# Altium project LED_CLUSTER.PrjPcb
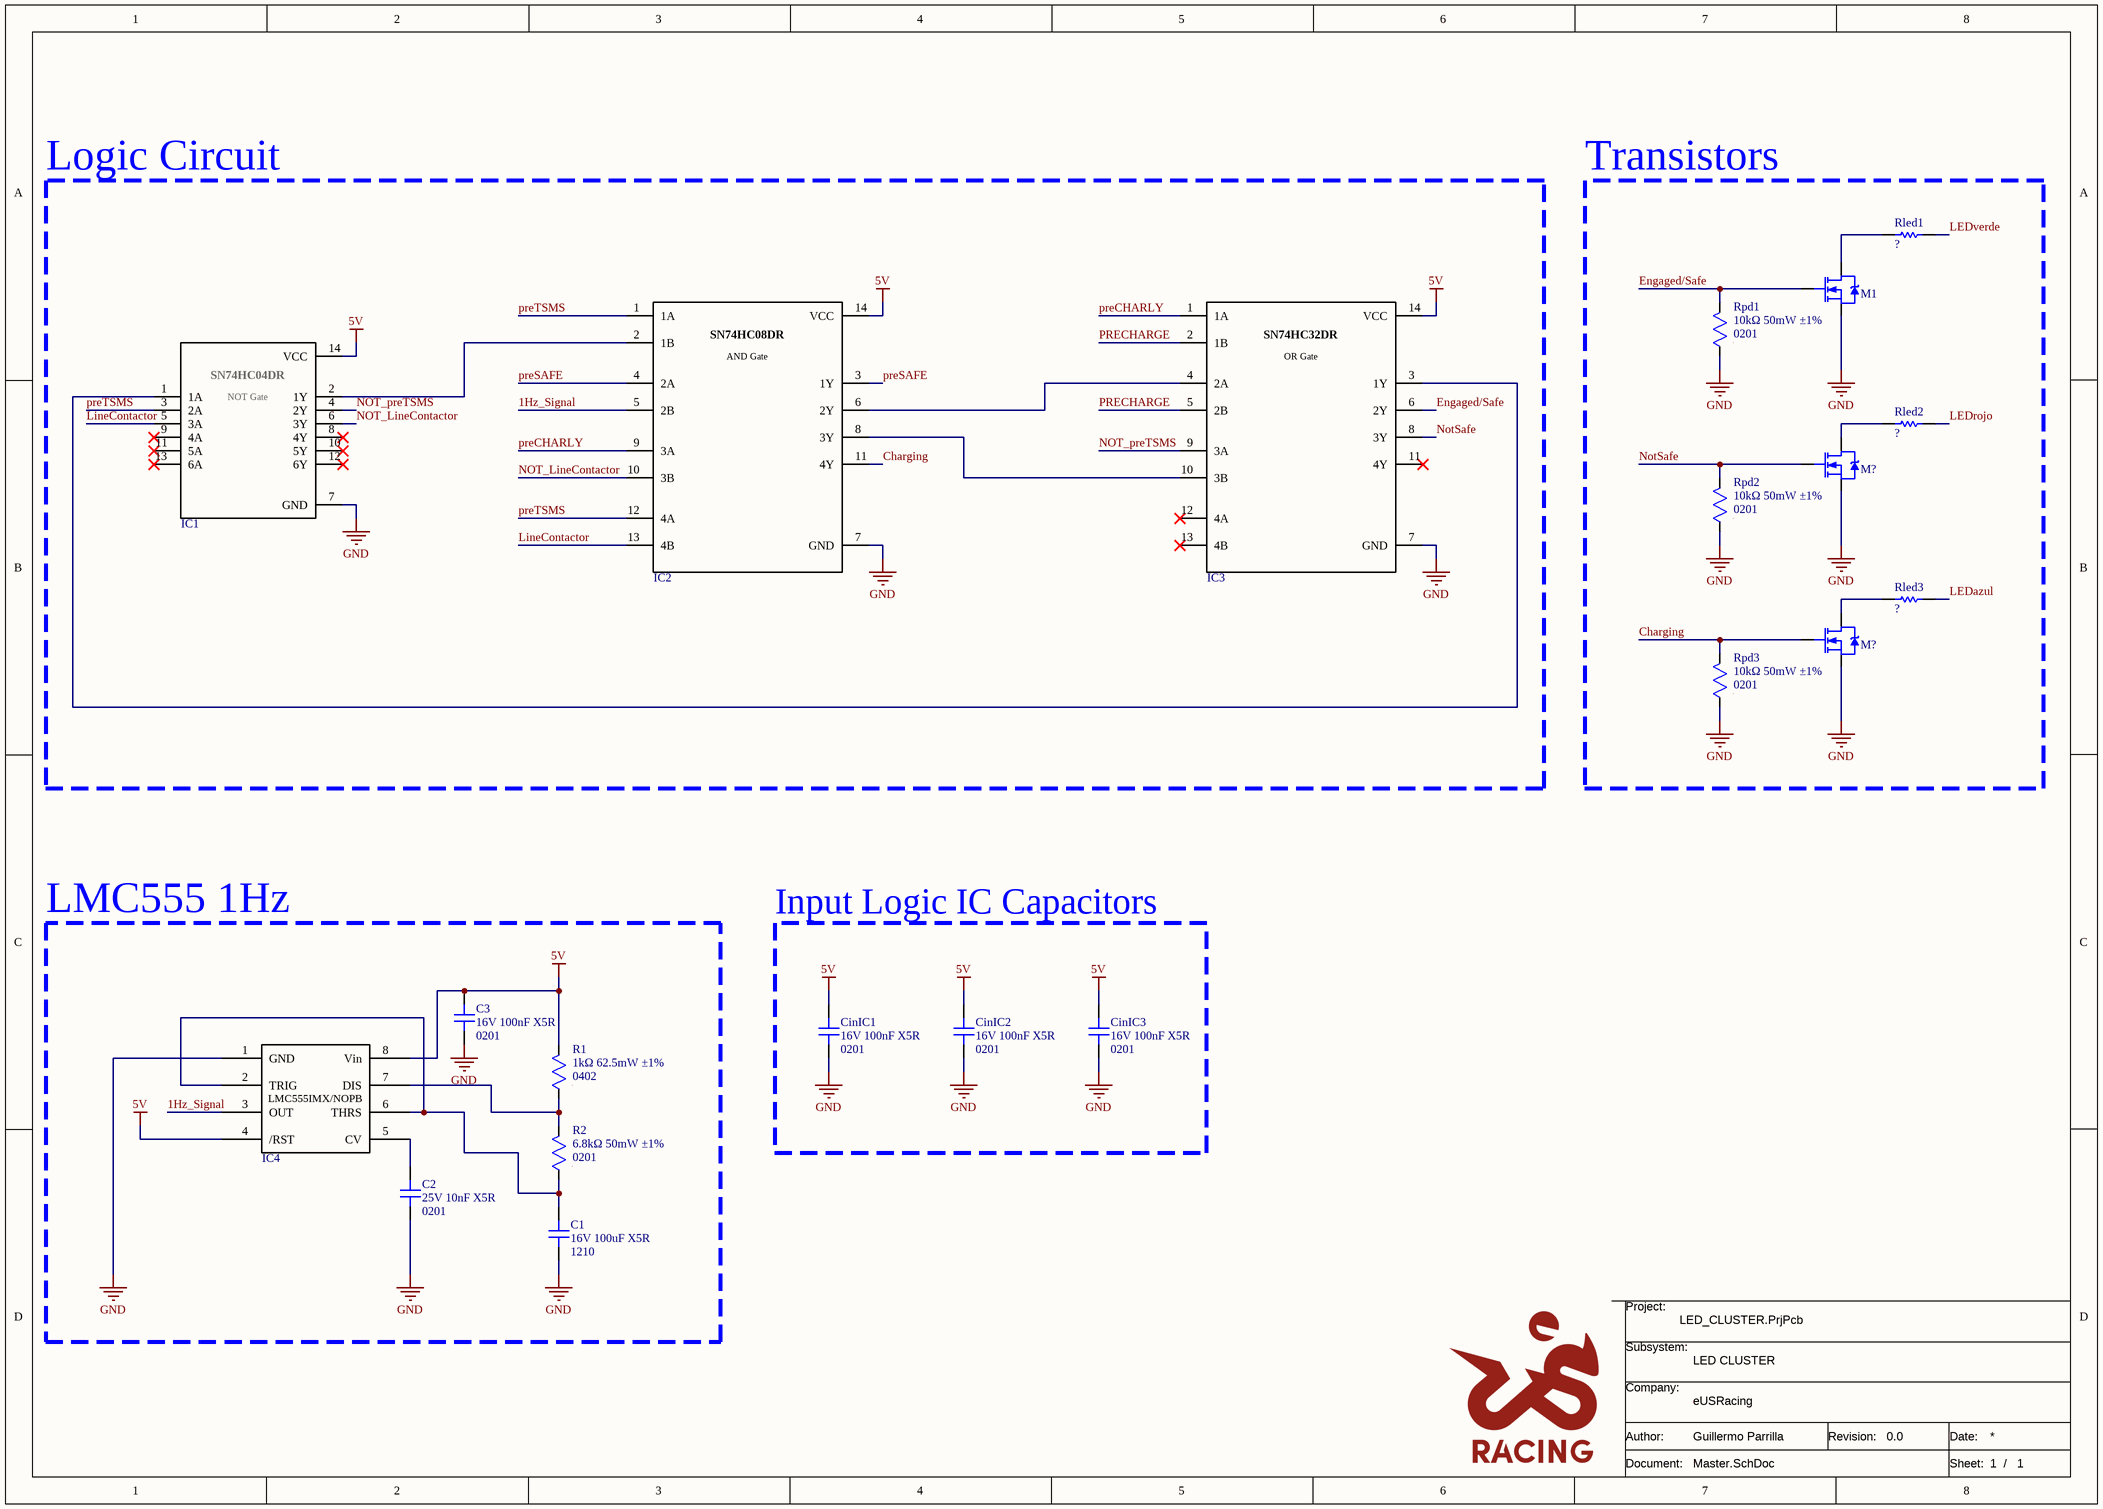
[diagram p0: Master.SchDoc]
Revision: 0.0; Project: LED Cluster; Date: 07/06/2026; Author: eUSRacing
1 sheet, 21 parts. Net scope: global (net labels, ports and power ports of the same name join across sheets).
Board file: LED_CLUSTER.PcbDoc

## Sheet Master.SchDoc: LED CLUSTER
size A3; CompanyName: eUSRacing; DrawnBy: Guillermo Parrilla; SheetNumber: 1; SheetTotal: 1

### Parts
(Parts that share a designator on the sheet are numbered #1, #2 ... from top to bottom, then left to right.)
C1  value 16V 100uF X5R  Package: 1210  [CAP SMD 1210]  (hidden comment: CAP non polarized)
C2  value 25V 10nF X5R  Package: 0201  [CAP SMD 0201]  (hidden comment: CAP non polarized)
C3  value 16V 100nF X5R  Package: 0201  [CAP SMD 0201]  (hidden comment: CAP non polarized)
CinIC1  value 16V 100nF X5R  Package: 0201  [CAP SMD 0201]  (hidden comment: CAP non polarized)
CinIC2  value 16V 100nF X5R  Package: 0201  [CAP SMD 0201]  (hidden comment: CAP non polarized)
CinIC3  value 16V 100nF X5R  Package: 0201  [CAP SMD 0201]  (hidden comment: CAP non polarized)
IC1  SN74HC04DR  [SOIC-14]  (value not drawn)
IC2  SN74HC08DR  [SOIC-14]  (value not drawn)
IC3  SN74HC32DR  [SOIC-14]  (value not drawn)
IC4  LMC555IMX/NOPB  [SOIC-8]  (value not drawn)
M1  MOSFET N  [SOT-323]  (value not drawn)
M?#1  MOSFET N  [SOT-323]  (value not drawn)
M?#2  MOSFET N  [SOT-323]  (value not drawn)
R1  value 1kΩ 62.5mW ±1%  Package: 0402  [RES SMD 0402]  (hidden comment: RES)
R2  value 6.8kΩ 50mW ±1%  Package: 0201  [RES SMD 0201]  (hidden comment: RES)
Rled1  Resistor  (value not drawn)
Rled2  Resistor  (value not drawn)
Rled3  Resistor  (value not drawn)
Rpd1  value 10kΩ 50mW ±1%  Package: 0201  [RES SMD 0201]  (hidden comment: RES)
Rpd2  value 10kΩ 50mW ±1%  Package: 0201  [RES SMD 0201]  (hidden comment: RES)
Rpd3  value 10kΩ 50mW ±1%  Package: 0201  [RES SMD 0201]  (hidden comment: RES)

### Blocks framed on the sheet
Logic Circuit: IC1-IC3
Transistors: M1 M?#1 M?#2 Rled1-Rled3 Rpd1-Rpd3
LMC555 1Hz: C1-C3 IC4 R1 R2
Input Logic IC Capacitors: CinIC1-CinIC3

### Nets
5V: C3.1 CinIC1.1 CinIC2.1 CinIC3.1 IC1.14(VCC) IC2.14(VCC) IC3.14(VCC) IC4.4(/RST) IC4.8(Vin) R1.2
GND: C1.2 C2.2 C3.2 CinIC1.2 CinIC2.2 CinIC3.2 IC1.7(GND) IC2.7(GND) IC3.7(GND) IC4.1(GND) M1.2(S) M?#1.2(S) M?#2.2(S) Rpd1.1 Rpd2.1 Rpd3.1
1Hz_Signal: IC2.5(2B) IC4.3(OUT)
Charging: IC2.11(4Y) M?#2.1(G) Rpd3.2
Engaged/Safe: IC3.6(2Y) M1.1(G) Rpd1.2
LEDazul: Rled3.2
LEDrojo: Rled2.2
LEDverde: Rled1.2
LineContactor: IC1.5(3A) IC2.13(4B)
NOT_LineContactor: IC1.6(3Y) IC2.10(3B)
NOT_preTSMS: IC1.4(2Y) IC3.9(3A)
NotSafe: IC3.8(3Y) M?#1.1(G) Rpd2.2
PRECHARGE: IC3.2(1B) IC3.5(2B)
preCHARLY: IC2.9(3A) IC3.1(1A)
preSAFE: IC2.3(1Y) IC2.4(2A)
preTSMS: IC1.3(2A) IC2.1(1A) IC2.12(4A)
NetC1_1: C1.1 IC4.2(TRIG) IC4.6(THRS) R2.1
NetC2_1: C2.1 IC4.5(CV)
NetIC1_1: IC1.1(1A) IC3.3(1Y)
NetIC1_2: IC1.2(1Y) IC2.2(1B)
NetIC2_6: IC2.6(2Y) IC3.4(2A)
NetIC2_8: IC2.8(3Y) IC3.10(3B)
NetIC4_7: IC4.7(DIS) R1.1 R2.2
NetM1_3: M1.3(D) Rled1.1
NetM?#1_3: M?#1.3(D) Rled2.1
NetM?#2_3: M?#2.3(D) Rled3.1

Not connected (* = marked no-connect by the designer): IC1 8(4Y)* 9(4A)* 10(5Y)* 11(5A)* 12(6Y)* 13(6A)*; IC3 11(4Y)* 12(4A)* 13(4B)*

### Notes on the sheet
- Project:
- Subsystem:
- Company:
- Document:
- Author:
- Revision:
- Date:
- Sheet:
- /

### Library data of the parts
C1 = 001-0065: 16V 100uF X5R ±20% 1210 Multilayer Ceramic Capacitors MLCC - SMD/SMT ROHS; MPN: HGC1210R5107M160NSVK; Manufacturer: Chinocera; ComponentLink1Description: Datasheet; ComponentLink1URL: https://www.lcsc.com/datasheet/lcsc_datasheet_2410121645_Chinocera-HGC1210R5107M160NSVK_C7432790.pdf; ComponentLink2Description: Distributor Link; ComponentLink2URL: https://www.lcsc.com/product-detail/Multilayer-Ceramic-Capacitors-MLCC-SMD-SMT_Chinocera-HGC1210R5107M160NSVK_C7432790.html; ID: 001-0065; Distributor PN: C7432790; Distributor: LCSC
C2 = 001-0012: 25V 10nF X5R ±10% 0201 Multilayer Ceramic Capacitors MLCC - SMD/SMT ROHS; MPN: GRM033R61E103KA12D; Manufacturer: Murata Electronics; ComponentLink1Description: Datasheet; ComponentLink1URL: https://www.lcsc.com/datasheet/lcsc_datasheet_1811081532_Murata-Electronics-GRM033R61E103KA12D_C76938.pdf; ComponentLink2Description: Distributor Link; ComponentLink2URL: https://www.lcsc.com/product-detail/Multilayer-Ceramic-Capacitors-MLCC-SMD-SMT_Murata-Electronics-GRM033R61E103KA12D_C76938.html; ID: 001-0012; Distributor PN: C76938; Distributor: LCSC
C3 CinIC1-CinIC3 = 001-0010: 16V 100nF X5R ±10% 0201 Multilayer Ceramic Capacitors MLCC - SMD/SMT ROHS; MPN: CL03A104KO3NNNC; Manufacturer: Samsung Electro-Mechanics; ComponentLink1Description: Datasheet; ComponentLink1URL: https://www.lcsc.com/datasheet/lcsc_datasheet_2304140030_Samsung-Electro-Mechanics-CL03A104KO3NNNC_C307380.pdf; ComponentLink2Description: Distributor Link; ComponentLink2URL: https://www.lcsc.com/product-detail/Multilayer-Ceramic-Capacitors-MLCC-SMD-SMT_Samsung-Electro-Mechanics-CL03A104KO3NNNC_C307380.html; ID: 001-0010; Distributor PN: C307380; Distributor: LCSC
IC1 = 051-0003: Inversores Hex A 595-SN74HC04D A 595-SN74HC04D A 59 A 595-SN74HC04D; Manufacturer: TI; Value: NOT Gate; ComponentLink1Description: Datasheet; ComponentLink1URL: https://www.ti.com/lit/gpn/sn54hc04-sp; ComponentLink2Description: Distributor Link; ComponentLink2URL: https://eu.mouser.com/es/ProductDetail/Texas-Instruments/SN74HC04DR?qs=5BZzbFV4k2tw1CBjnu%2F%252B9Q%3D%3D; ID: 051-0003; Package: SOIC-14; MPN: SN74HC04DR; Distributor PN: 595-SN74HC04DR; Distributor: Mouser
IC2 = 051-0002: Puertas lógicas Quad 2-Input A 595-S N74HC08D A 595-SN74 A 595-SN74HC08D; Manufacturer: TI; Value: AND Gate; ComponentLink1Description: Datasheet; ComponentLink1URL: https://www.ti.com/lit/gpn/sn54hc08-sp; ComponentLink2Description: Distributor Link; ComponentLink2URL: https://eu.mouser.com/es/ProductDetail/Texas-Instruments/SN74HC08DR?qs=sGAEpiMZZMutXGli8Ay4kEEIpW4eUuOm7aqjfwxQiBw%3D; ID: 051-0002; Package: SOIC-14; MPN: SN74HC08DR; Distributor PN: 595-SN74HC08DR; Distributor: Mouser
IC3 = 051-0001: Puertas lógicas Quad 2-Input A 595-S N74HCT32N A 595-SN7 A 595-SN74HCT32N; Manufacturer: TI; Value: OR Gate; ComponentLink1Description: Datasheet; ComponentLink1URL: https://www.ti.com/lit/gpn/sn74hc32; ComponentLink2Description: Distributor Link; ComponentLink2URL: https://eu.mouser.com/es/ProductDetail/Texas-Instruments/SN74HC32DR?qs=JHHQeKcAU3Du%2FzZijx6RtA%3D%3D; ID: 051-0001; Package: SOIC-14; MPN: SN74HC32DR; Distributor PN: 595-SN74HC32DR; Distributor: Mouser
IC4 = 051-0004: Temporizadores y productos de apoyo CMOS Timer A 595-LMC 555IM/NOPB A 595-LM A 595-LMC555IM/NOPB; Manufacturer: TI; Value: "555"; ComponentLink1Description: Datasheet; ComponentLink1URL: https://www.ti.com/lit/gpn/lmc555; ComponentLink2Description: Distributor Link; ComponentLink2URL: https://eu.mouser.com/es/ProductDetail/Texas-Instruments/LMC555IMX-NOPB?qs=sGAEpiMZZMutXGli8Ay4kNAnUfdQpJkZNpfT8w9oXWg%3D; ID: 051-0004; Package: SOIC-8; MPN: LMC555IMX/NOPB; Distributor PN: 595-LMC555IMX/NOPB; Distributor: Mouser
M1 M?#1 M?#2 = 043-0004: MOSFET 30V N-Channel Enhancement Mode MOSFET; MPN: PJC7400_R1_00001; Manufacturer: Panjit; ComponentLink1Description: Datasheet; ComponentLink1URL: https://eu.mouser.com/datasheet/3/3736/1/57EA10CD49B35B6F90316A98635696137E5C0903FA72E2DBB5D027E51D732D72.pdf; ComponentLink2Description: Distributor Link; ComponentLink2URL: https://eu.mouser.com/es/ProductDetail/Panjit/PJC7400_R1_00001?qs=sPbYRqrBIVlqNtfR5hXF4A%3D%3D; ID: 043-0004; Value: N; Package: SOT-323; Distributor PN: 241-PJC7400_R1_00001; Distributor: Mouser
R1 = 010-0113: 62.5mW 1kΩ 50V ±100ppm/℃ Thick Film Resistor ±1% 0402 Chip Resistor - Surface Mount ROHS; MPN: FRC0402F1001TS; Manufacturer: FOJAN; ComponentLink1Description: Datasheet; ComponentLink1URL: https://www.lcsc.com/product-detail/C2906864.html?s_z=n_FRC0402F1001TS; ComponentLink2Description: Distributor Link; ComponentLink2URL: https://www.lcsc.com/product-detail/C2906864.html?s_z=n_FRC0402F1001TS; ID: 010-0113; Distributor PN: C2906864; Distributor: LCSC
R2 = 010-0073: 50mW Thick Film Resistors 25V ±1% ±200ppm/℃ 6.8kΩ 0201 Chip Resistor - Surface Mount ROHS; MPN: 0201WMF6801TEE; Manufacturer: UNI-ROYAL(Uniroyal Elec); ComponentLink1Description: Datasheet; ComponentLink1URL: https://www.lcsc.com/datasheet/lcsc_datasheet_2411221126_UNI-ROYAL-Uniroyal-Elec-0201WMF6801TEE_C423451.pdf; ComponentLink2Description: Distributor Link; ComponentLink2URL: https://www.lcsc.com/product-detail/Chip-Resistor-Surface-Mount_UNI-ROYAL-Uniroyal-Elec-0201WMF6801TEE_C423451.html; ID: 010-0073; Distributor PN: C423451; Distributor: LCSC
Rled1-Rled3 = Resistor: TC1: 0; SimulationGenericComponent: True; TC2: 0; Value: ?
Rpd1-Rpd3 = 010-0011: 50mW Thick Film Resistors 25V ±1% ±200ppm/℃ 10kΩ 0201 Chip Resistor - Surface Mount ROHS; MPN: 0201WMF1002TEE; Manufacturer: UNI-ROYAL(Uniroyal Elec); ComponentLink1Description: Datasheet; ComponentLink1URL: https://www.lcsc.com/datasheet/lcsc_datasheet_2205312145_UNI-ROYAL-Uniroyal-Elec-0201WMF1002TEE_C473048.pdf; ComponentLink2Description: Distributor Link; ComponentLink2URL: https://www.lcsc.com/product-detail/Chip-Resistor-Surface-Mount_UNI-ROYAL-Uniroyal-Elec-0201WMF1002TEE_C473048.html; ID: 010-0011; Distributor PN: C473048; Distributor: LCSC

## Assembly variants
Desarrollo: all parts fitted